# EAGLE design msx_vdp_slot (EAGLE 7.6.0)
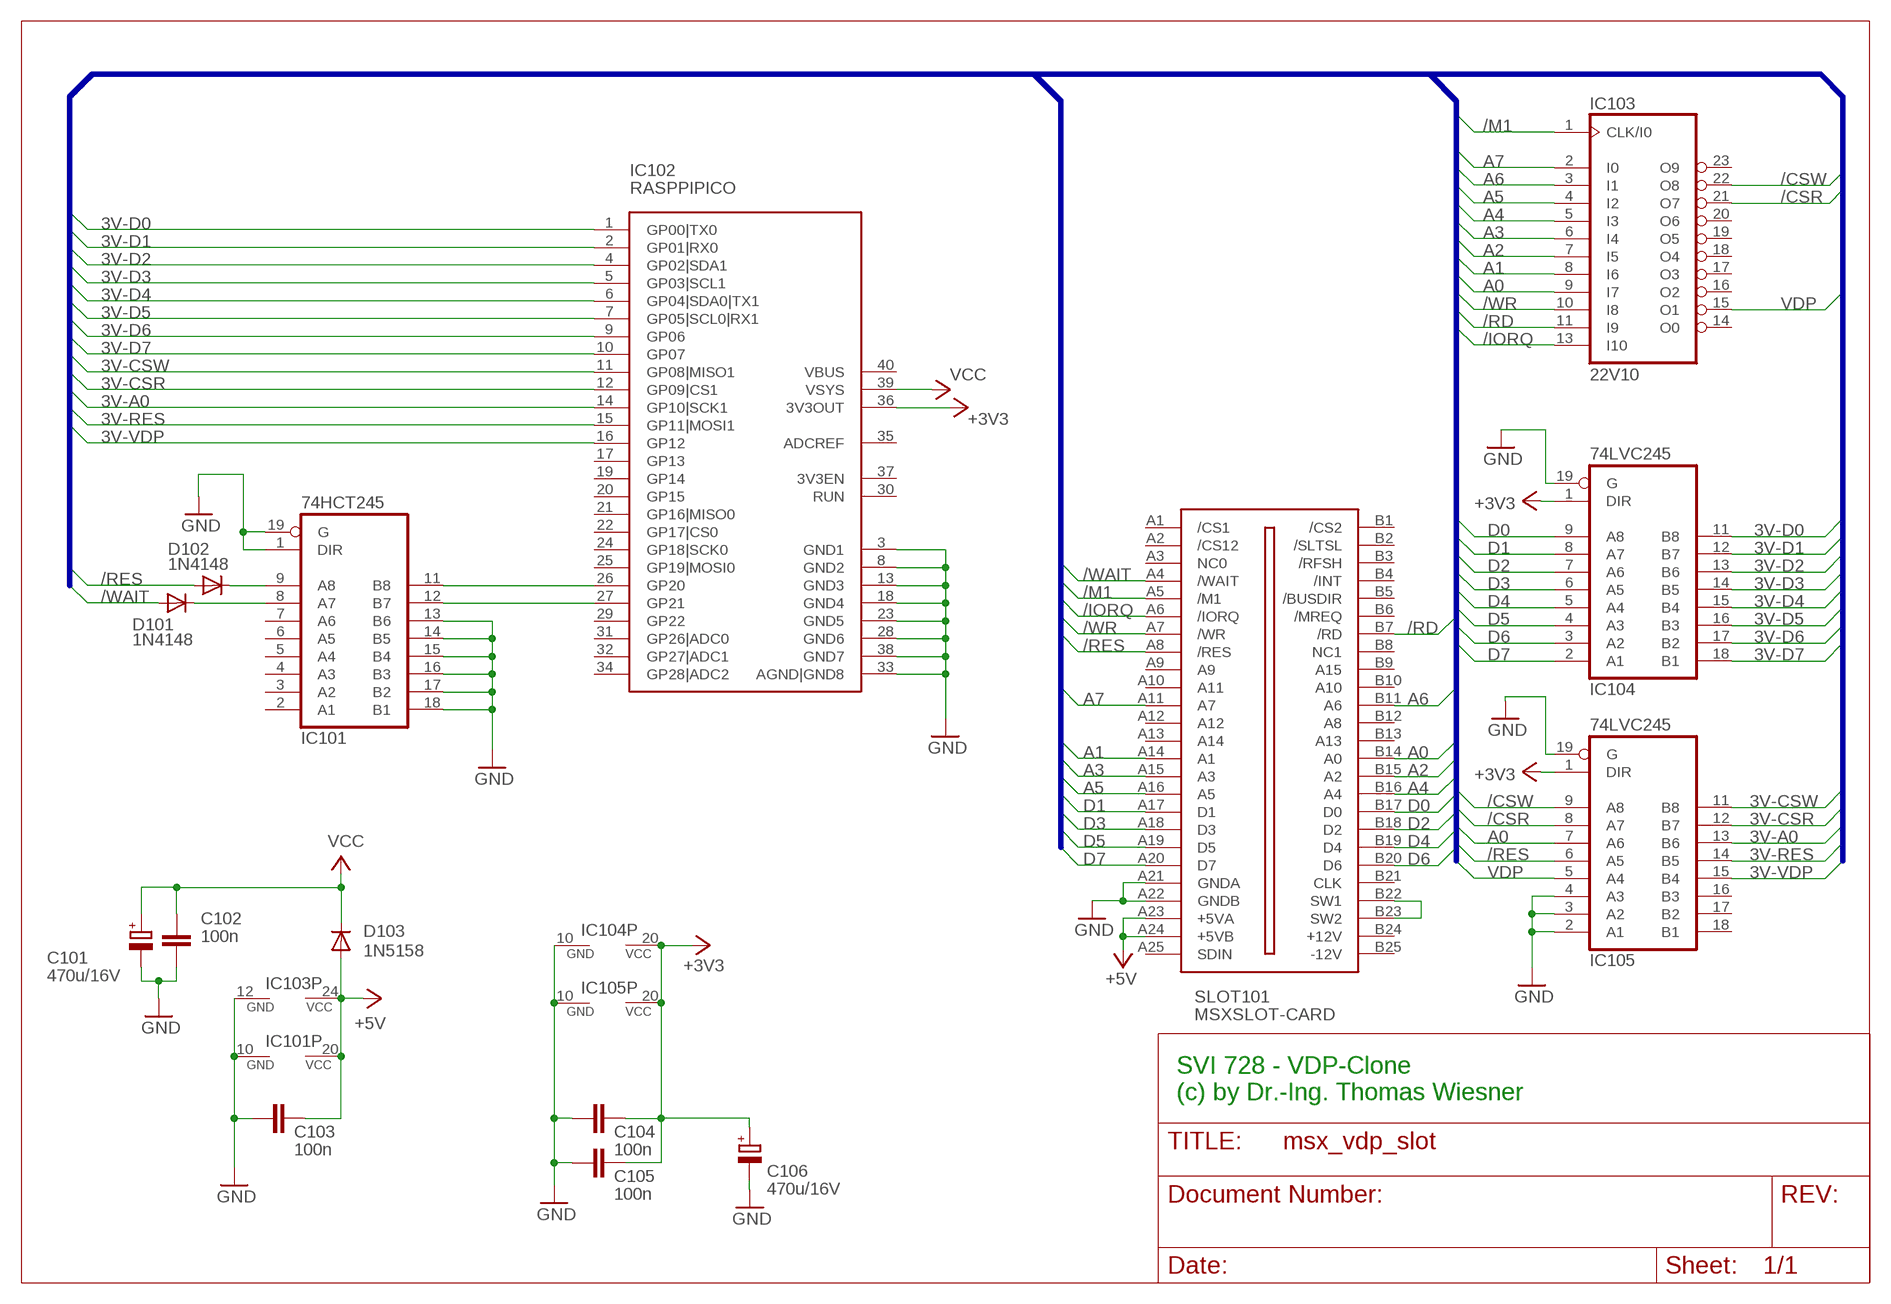
[diagram p0: schematic, sheet 1]

## Parts
C101  470u/16V  CPOL-EUE3.5-8  [E3,5-8]
C102  100n  C-EU025-025X050  [C025-025X050]
C103  100n  C-EU025-025X050  [C025-025X050]
C104  100n  C-EU025-025X050  [C025-025X050]
C105  100n  C-EU025-025X050  [C025-025X050]
C106  470u/16V  CPOL-EUE3.5-8  [E3,5-8]
D101  1N4148  1N4148DO35-10  [DO35-10]
D102  1N4148  1N4148DO35-10  [DO35-10]
D103  1N5158  1N4004  [DO41-10]
IC101  74HCT245  74HCT245N  [DIL20]
IC102  RASPPIPICO  [RASPPIPICO]
IC103  22V10  [DIL24-3]
IC104  74LVC245  74HCT245N  [DIL20]
IC105  74LVC245  74HCT245N  [DIL20]
SLOT101  MSXSLOT-CARD  [MSXCARD]

## Nets
3V-A0: IC102.14(GP10|SCK1) IC105.13(B6)
3V-CSR: IC102.12(GP09|CS1) IC105.12(B7)
3V-CSW: IC102.11(GP08|MISO1) IC105.11(B8)
3V-D0: IC102.1(GP00|TX0) IC104.11(B8)
3V-D1: IC102.2(GP01|RX0) IC104.12(B7)
3V-D2: IC102.4(GP02|SDA1) IC104.13(B6)
3V-D3: IC102.5(GP03|SCL1) IC104.14(B5)
3V-D4: IC102.6(GP04|SDA0|TX1) IC104.15(B4)
3V-D5: IC102.7(GP05|SCL0|RX1) IC104.16(B3)
3V-D6: IC102.9(GP06) IC104.17(B2)
3V-D7: IC102.10(GP07) IC104.18(B1)
3V-RES: IC102.15(GP11|MOSI1) IC105.14(B5)
3V-VDP: IC102.16(GP12) IC105.15(B4)
+3V3: C104.1 C105.1 C106.+ IC102.36(3V3OUT) IC104.1(DIR) IC104.20(VCC) IC105.1(DIR) IC105.20(VCC)
+5V: C103.1 D103.A IC101.20(VCC) IC103.24(VCC) SLOT101.A23(+5VA) SLOT101.A24(+5VB)
/CSR: IC103.21(O7) IC105.8(A7)
/CSW: IC103.22(O8) IC105.9(A8)
/IORQ: IC103.13(I10) SLOT101.A6(/IORQ)
/M1: IC103.1(CLK/I0) SLOT101.A5(/M1)
/RD: IC103.11(I9) SLOT101.B7(/RD)
/RES: D102.A IC105.6(A5) SLOT101.A8(/RES)
/WAIT: D101.A SLOT101.A4(/WAIT)
/WR: IC103.10(I8) SLOT101.A7(/WR)
A0: IC103.9(I7) IC105.7(A6) SLOT101.B14(A0)
A1: IC103.8(I6) SLOT101.A14(A1)
A2: IC103.7(I5) SLOT101.B15(A2)
A3: IC103.6(I4) SLOT101.A15(A3)
A4: IC103.5(I3) SLOT101.B16(A4)
A5: IC103.4(I2) SLOT101.A16(A5)
A6: IC103.3(I1) SLOT101.B11(A6)
A7: IC103.2(I0) SLOT101.A11(A7)
D0: IC104.9(A8) SLOT101.B17(D0)
D1: IC104.8(A7) SLOT101.A17(D1)
D2: IC104.7(A6) SLOT101.B18(D2)
D3: IC104.6(A5) SLOT101.A18(D3)
D4: IC104.5(A4) SLOT101.B19(D4)
D5: IC104.4(A3) SLOT101.A19(D5)
D6: IC104.3(A2) SLOT101.B20(D6)
D7: IC104.2(A1) SLOT101.A20(D7)
GND: C101.- C102.2 C103.2 C104.2 C105.2 C106.- IC101.1(DIR) IC101.10(GND) IC101.13(B6) IC101.14(B5) IC101.15(B4) IC101.16(B3) IC101.17(B2) IC101.18(B1) IC101.19(G) IC102.3(GND1) IC102.8(GND2) IC102.13(GND3) IC102.18(GND4) IC102.23(GND5) IC102.28(GND6) IC102.33(AGND|GND8) IC102.38(GND7) IC103.12(GND) IC104.10(GND) IC104.19(G) IC105.2(A1) IC105.3(A2) IC105.4(A3) IC105.10(GND) IC105.19(G) SLOT101.A21(GNDA) SLOT101.A22(GNDB)
N$1: D102.C IC101.9(A8)
N$2: D101.C IC101.8(A7)
N$3: IC101.12(B7) IC102.27(GP21)
N$4: IC101.11(B8) IC102.26(GP20)
N$17: SLOT101.B22(SW1) SLOT101.B23(SW2)
VCC: C101.+ C102.1 D103.C IC102.39(VSYS)
VDP: IC103.15(O1) IC105.5(A4)
Unconnected: IC101.2(A1) IC101.3(A2) IC101.4(A3) IC101.5(A4) IC101.6(A5) IC101.7(A6) IC102.17(GP13) IC102.19(GP14) IC102.20(GP15) IC102.21(GP16|MISO0) IC102.22(GP17|CS0) IC102.24(GP18|SCK0) IC102.25(GP19|MOSI0) IC102.29(GP22) IC102.30(RUN) IC102.31(GP26|ADC0) IC102.32(GP27|ADC1) IC102.34(GP28|ADC2) IC102.37(3V3EN) IC103.14(O0) IC103.16(O2) IC103.17(O3) IC103.18(O4) IC103.19(O5) IC103.20(O6) IC103.23(O9) IC105.16(B3) IC105.17(B2) IC105.18(B1) SLOT101.A1(/CS1) SLOT101.A2(/CS12) SLOT101.A3(NC0) SLOT101.A9 SLOT101.A10(A11) SLOT101.A12 SLOT101.A13(A14) SLOT101.A25(SDIN) SLOT101.B1(/CS2) SLOT101.B2(/SLTSL) SLOT101.B3(/RFSH) SLOT101.B4(/INT) SLOT101.B5(/BUSDIR) SLOT101.B6(/MREQ) SLOT101.B8(NC1) SLOT101.B9(A15) SLOT101.B10(A10) SLOT101.B12(A8) SLOT101.B13(A13) SLOT101.B21(CLK) SLOT101.B24(+12V) SLOT101.B25(-12V)

## Buses
B$4

## Notes on the sheet
- SVI 728 - VDP-Clone
  (c) by Dr.-Ing. Thomas Wiesner

## Power pins joined to a net without a drawn wire
ADCREF: IC102.35(ADCREF)
VBUS: IC102.40(VBUS)

## Library data of the parts
C101 C106 = rcl:CPOL-EU: POLARIZED CAPACITOR, European symbol
C102-C105 = rcl:C-EU: CAPACITOR, European symbol
D101 D102 = diode:1N4148: DIODE high speed (Philips)
D103 = diode:1N4004: DIODE general purpose rectifier, 1 A
IC101 IC104 IC105 = 74xx-eu:74*245: Octal BUS TRANSCEIVER, 3-state
IC102 = mbc:RASPPIPICO
IC103 = pal:22V10: PAL; MPN: GAL22V10D-7LPN; OC_FARNELL: 1571925; OC_NEWARK: 97M0480
SLOT101 = mbc:MSXSLOT: MSX-Slot-Verbinder

## Board
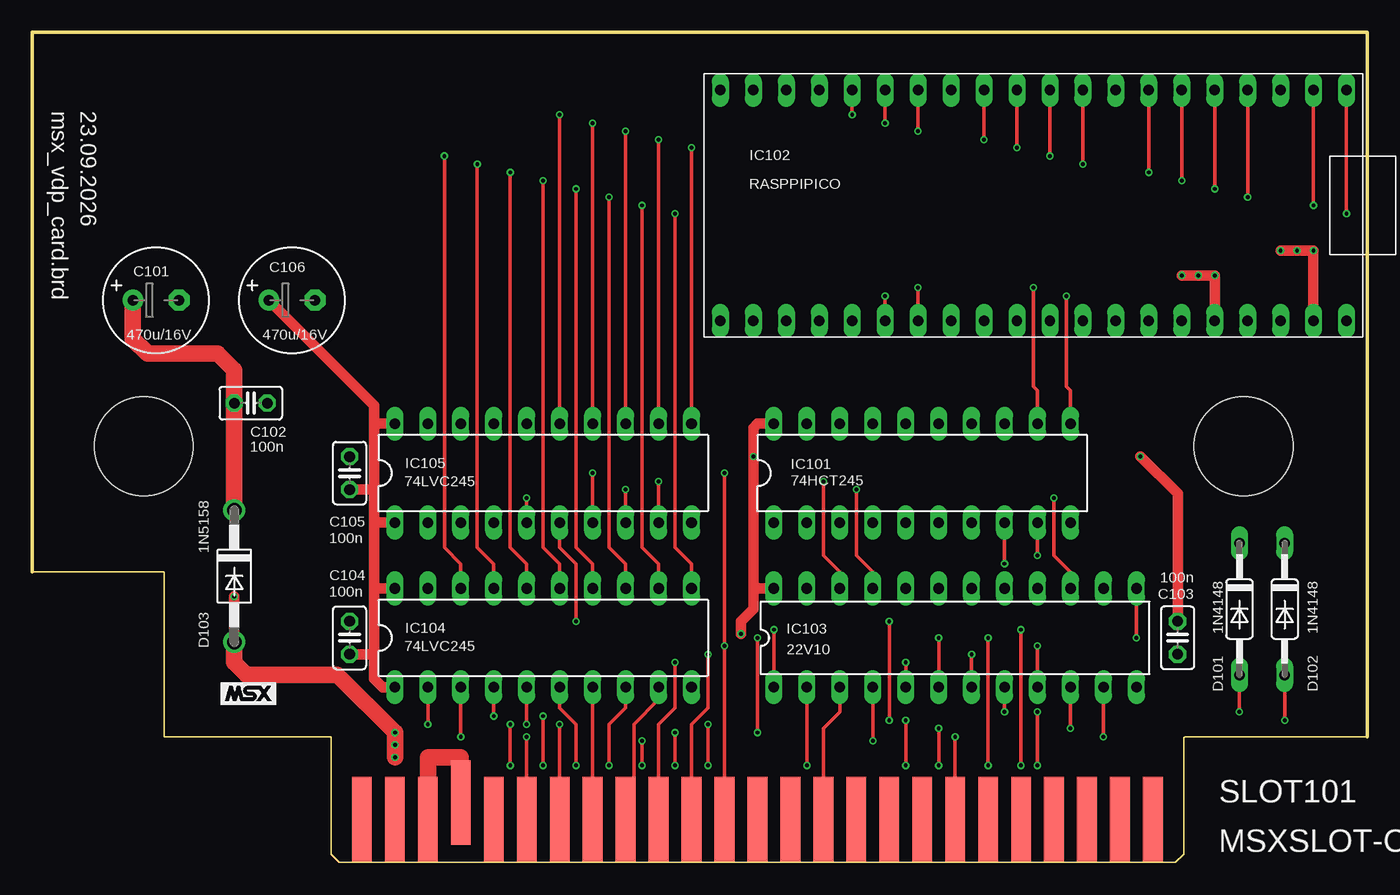
[diagram p1: board, top side]
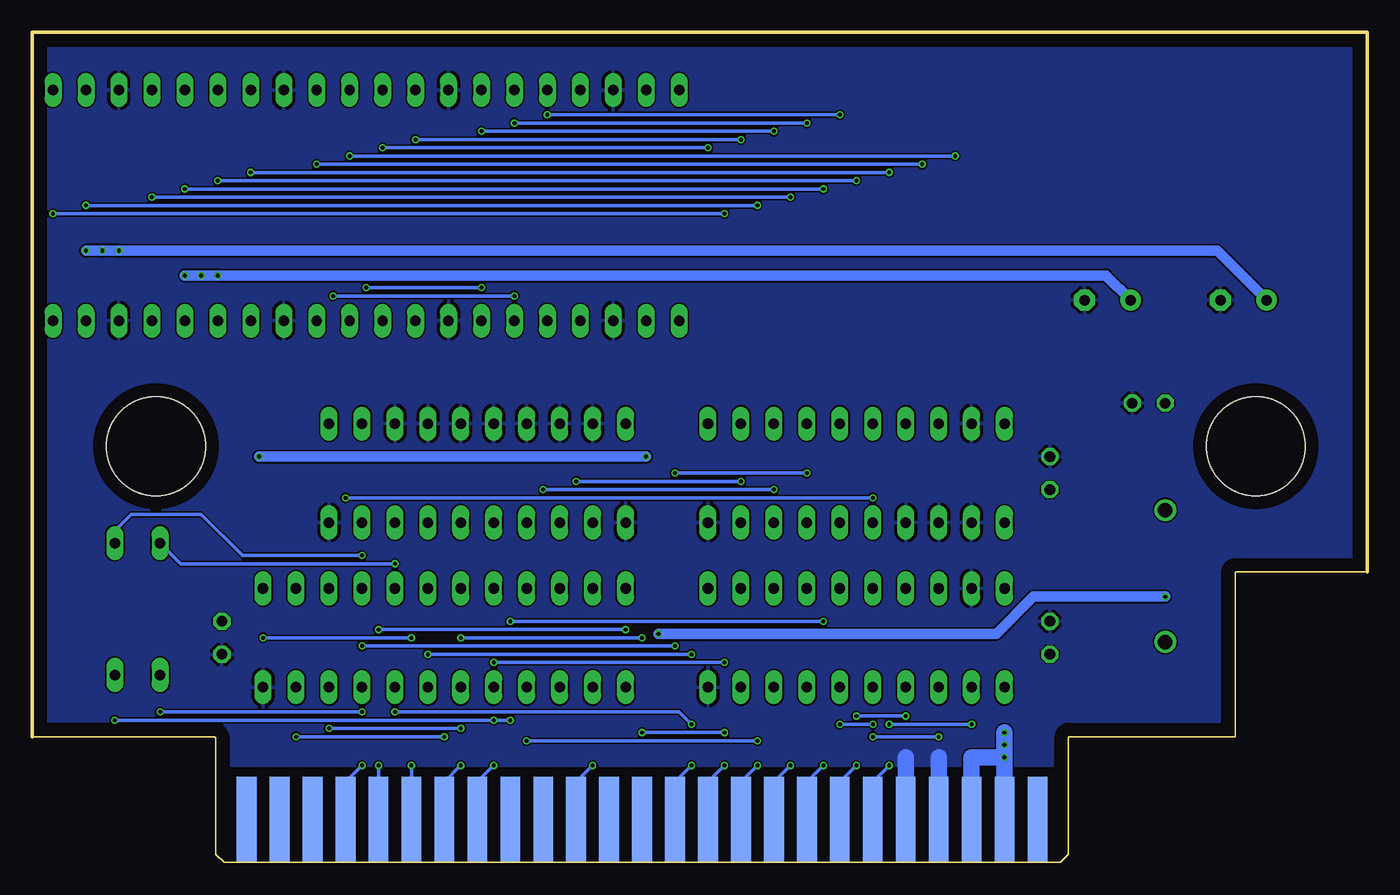
[diagram p2: board, bottom side, seen from below]

Size 102.87 x 63.98 mm. Coordinates in mm from the lower left corner, seen from the top.
Outline: 0,22.38 0,63.98 102.87,63.98 102.87,9.68
Copper layers (1*16): Top 0.035mm / dielectric 1.5mm / Bottom 0.035mm
Design rules "default *": minimum track width 0.125mm, minimum drill 0.2mm, track to track 0.125mm, track to pad 0.125mm, pad to pad 0.125mm, via to via 0.125mm, smd to smd 0.125mm, copper to edge 40mil, drill to drill 8mil, minimum pad ring 10mil, minimum via ring 0.125mm, stop-mask expansion 4mil, vias tented up to drill 0mil, thermal gap 10mil

### Footprints (pad centres in the part's own frame; a part is rotated, then mirrored left to right if it is on the bottom)
E3,5-8 = drill 0.813 pad 1.6: + -1.778,0 | drill 0.813 pad 1.6 octagon: - 1.778,0
C025-025X050 = drill 0.813 octagon: 1 -1.27,0; 2 1.27,0
DO35-10 = drill 0.813 long: A 5.08,0; C -5.08,0
DO41-10 = drill 1.118: A 5.08,0; C -5.08,0
DIL20 = drill 0.813 long: 1 -11.43,-3.81; 2 -8.89,-3.81; 3 -6.35,-3.81; 4 -3.81,-3.81; 5 -1.27,-3.81; 6 1.27,-3.81; 7 3.81,-3.81; 8 6.35,-3.81; 9 8.89,-3.81; 10 11.43,-3.81; 11 11.43,3.81; 12 8.89,3.81; 13 6.35,3.81; 14 3.81,3.81; 15 1.27,3.81; 16 -1.27,3.81; 17 -3.81,3.81; 18 -6.35,3.81; 19 -8.89,3.81; 20 -11.43,3.81
RASPPIPICO = drill 0.8 long: 1 -8.89,24.13; 2 -8.89,21.59; 3 -8.89,19.05; 4 -8.89,16.51; 5 -8.89,13.97; 6 -8.89,11.43; 7 -8.89,8.89; 8 -8.89,6.35; 9 -8.89,3.81; 10 -8.89,1.27; 11 -8.89,-1.27; 12 -8.89,-3.81; 13 -8.89,-6.35; 14 -8.89,-8.89; 15 -8.89,-11.43; 16 -8.89,-13.97; 17 -8.89,-16.51; 18 -8.89,-19.05; 19 -8.89,-21.59; 20 -8.89,-24.13; 21 8.89,-24.13; 22 8.89,-21.59; 23 8.89,-19.05; 24 8.89,-16.51; 25 8.89,-13.97; 26 8.89,-11.43; 27 8.89,-8.89; 28 8.89,-6.35; 29 8.89,-3.81; 30 8.89,-1.27; 31 8.89,1.27; 32 8.89,3.81; 33 8.89,6.35; 34 8.89,8.89; 35 8.89,11.43; 36 8.89,13.97; 37 8.89,16.51; 38 8.89,19.05; 39 8.89,21.59; 40 8.89,24.13
DIL24-3 = drill 0.813 long: 1 -13.97,-3.81; 2 -11.43,-3.81; 3 -8.89,-3.81; 4 -6.35,-3.81; 5 -3.81,-3.81; 6 -1.27,-3.81; 7 1.27,-3.81; 8 3.81,-3.81; 9 6.35,-3.81; 10 8.89,-3.81; 11 11.43,-3.81; 12 13.97,-3.81; 13 13.97,3.81; 14 11.43,3.81; 15 8.89,3.81; 16 6.35,3.81; 17 3.81,3.81; 18 1.27,3.81; 19 -1.27,3.81; 20 -3.81,3.81; 21 -6.35,3.81; 22 -8.89,3.81; 23 -11.43,3.81; 24 -13.97,3.81
MSXCARD = smd 1.524 x 6.477 bottom: A1 -25.4,2.54; A2 -27.94,2.54; A3 -30.48,2.54; A4 -33.02,2.54; A5 -35.56,2.54; A6 -38.1,2.54; A7 -40.64,2.54; A8 -43.18,2.54; A9 -45.72,2.54; A10 -48.26,2.54; A11 -50.8,2.54; A12 -53.34,2.54; A13 -55.88,2.54; A14 -58.42,2.54; A15 -60.96,2.54; A16 -63.5,2.54; A17 -66.04,2.54; A18 -68.58,2.54; A19 -71.12,2.54; A20 -73.66,2.54; A21 -76.2,2.54; A22 -78.74,2.54; A23 -81.28,2.54; A24 -83.82,2.54; A25 -86.36,2.54 | smd 1.524 x 6.477: B1 -25.4,2.54; B2 -27.94,2.54; B3 -30.48,2.54; B4 -33.02,2.54; B5 -35.56,2.54; B6 -38.1,2.54; B7 -40.64,2.54; B8 -43.18,2.54; B9 -45.72,2.54; B10 -48.26,2.54; B11 -50.8,2.54; B12 -53.34,2.54; B13 -55.88,2.54; B14 -58.42,2.54; B15 -60.96,2.54; B16 -63.5,2.54; B17 -66.04,2.54; B18 -68.58,2.54; B19 -71.12,2.54; B20 -73.66,2.54; B21 -76.2,2.54; B22 -78.74,3.81; B23 -81.28,2.54; B24 -83.82,2.54; B25 -86.36,2.54 | hole 7.62: -103.188,31.274; -18.415,31.274

### Placement (x,y rotation side)
C101  9.53,43.34 0 top
C102  16.83,35.4 0 top
C103  88.27,17.3 270 top
C104  24.45,17.3 90 top
C105  24.45,30 90 top
C106  20,43.34 0 top
D101  93.03,19.53 270 top
D102  96.52,19.53 270 top
D103  15.56,22.07 270 top
IC101  68.58,30 0 top
IC102  77.15,50.64 270 top
IC103  71.12,17.3 0 top
IC104  39.37,17.3 0 top
IC105  39.37,30 0 top
SLOT101  111.76,0.79 0 top

### Tracks (layer width: path | path; a pad name or v marks a point on that pad's centre or on a via)
3V-A0  (via drill 0.3)
  Top 0.254: IC105.13 v45.72,56.36 | v68.26,56.36 IC102.14
  Bottom 0.254: v45.72,56.36 v68.26,56.36
3V-CSR  (via drill 0.3)
  Top 0.254: IC105.12 v48.26,55.72 | v73.34,55.72 IC102.12
  Bottom 0.254: v48.26,55.72 v73.34,55.72
3V-CSW  (via drill 0.3)
  Top 0.254: IC105.11 v50.8,55.09 | v75.88,55.09 IC102.11
  Bottom 0.254: v50.8,55.09 v75.88,55.09
3V-D0  (via drill 0.3)
  Top 0.254: IC104.11 50.8,23.02 49.53,24.29 v49.53,50.01 | v101.28,50.01 IC102.1
  Bottom 0.254: v49.53,50.01 v101.28,50.01
3V-D1  (via drill 0.3)
  Top 0.254: IC104.12 48.26,23.02 46.99,24.29 v46.99,50.64 | v98.74,50.64 IC102.2
  Bottom 0.254: v46.99,50.64 v98.74,50.64
3V-D2  (via drill 0.3)
  Top 0.254: IC104.13 45.72,23.02 44.45,24.29 v44.45,51.28 | v93.66,51.28 IC102.4
  Bottom 0.254: v44.45,51.28 v93.66,51.28
3V-D3  (via drill 0.3)
  Top 0.254: IC104.14 43.18,23.02 41.91,24.29 v41.91,51.91 | v91.12,51.91 IC102.5
  Bottom 0.254: v41.91,51.91 v91.12,51.91
3V-D4  (via drill 0.3)
  Top 0.254: IC104.15 40.64,23.02 39.37,24.29 v39.37,52.55 | v88.58,52.55 IC102.6
  Bottom 0.254: v39.37,52.55 v88.58,52.55
3V-D5  (via drill 0.3)
  Top 0.254: IC104.16 38.1,23.02 36.83,24.29 v36.83,53.18 | v86.04,53.18 IC102.7
  Bottom 0.254: v36.83,53.18 v86.04,53.18
3V-D6  (via drill 0.3)
  Top 0.254: IC104.17 35.56,23.02 34.29,24.29 v34.29,53.82 | v80.96,53.82 IC102.9
  Bottom 0.254: v34.29,53.82 v80.96,53.82
3V-D7  (via drill 0.3)
  Top 0.254: IC104.18 33.02,23.02 31.75,24.29 v31.75,54.45 | v78.42,54.45 IC102.10
  Bottom 0.254: v31.75,54.45 v78.42,54.45
3V-RES  (via drill 0.3)
  Top 0.254: IC105.14 v43.18,56.99 | v65.72,56.99 IC102.15
  Bottom 0.254: v43.18,56.99 v65.72,56.99
3V-VDP  (via drill 0.3)
  Top 0.254: IC105.15 v40.64,57.63 | v63.18,57.63 IC102.16
  Bottom 0.254: v40.64,57.63 v63.18,57.63
+3V3  (via drill 0.3)
  Top 0.813: IC104.1 26.99,13.49 26.35,14.13 26.35,16.03 | 26.35,16.03 26.35,21.11 | 26.35,21.11 26.35,26.19 | 26.35,26.19 26.35,28.73 | 26.35,28.73 26.35,33.81 | 26.35,33.81 26.35,35.21 C106.+ | C105.1 26.35,28.73 | IC104.20 26.35,21.11 | IC105.1 26.35,26.19 | C104.1 26.35,16.03 | IC105.20 26.35,33.81 | IC102.36 v91.12,45.24 v89.85,45.24 v88.58,45.24
  Bottom 0.813: C106.+ 20.13,45.24 v88.58,45.24 v89.85,45.24 v91.12,45.24
+5V  (via drill 0.3)
  Top 0.813: IC101.20 55.88,33.81 55.56,33.5 v55.56,31.27 55.56,21.43 | 55.56,21.43 55.88,21.11 IC103.24 | C103.1 88.27,28.42 v85.41,31.27 | 55.56,21.43 55.56,19.53 54.61,18.57 v54.61,17.62 | v15.56,20.48 D103.A
  Top 1.27: D103.A 15.56,15.4 16.51,14.45 23.5,14.45 v27.94,10 v27.94,9.05 v27.94,8.1
  Bottom 0.813: v85.41,31.27 v55.56,31.27 | v54.61,17.62 28.58,17.62 25.72,20.48 v15.56,20.48
  Bottom 1.27: SLOT101.A23 30.48,8.1 v27.94,8.1 | v27.94,8.1 SLOT101.A24 | v27.94,8.1 v27.94,9.05 v27.94,10
/CSR  (via drill 0.3)
  Top 0.254: IC103.21 64.77,22.38 63.5,23.65 v63.5,28.73 | v45.72,28.73 IC105.8
  Bottom 0.254: v63.5,28.73 v45.72,28.73
/CSW  (via drill 0.3)
  Top 0.254: IC103.22 62.23,22.38 60.96,23.65 v60.96,29.37 | v48.26,29.37 IC105.9
  Bottom 0.254: v60.96,29.37 v48.26,29.37
/IORQ  (via drill 0.3)
  Top 0.254: v73.66,7.46 v73.66,17.3 | v85.09,17.3 IC103.13
  Bottom 0.254: SLOT101.A6 v73.66,7.46 | v73.66,17.3 v85.09,17.3
/M1  (via drill 0.3)
  Top 0.254: v76.2,7.46 v76.2,17.94 | v57.15,17.94 IC103.1
  Bottom 0.254: SLOT101.A5 v76.2,7.46 | v76.2,17.94 v57.15,17.94
/RD  (via drill 0.3)
  Top 0.254: IC103.11 v82.55,9.68 | v71.12,9.68 SLOT101.B7
  Bottom 0.254: v82.55,9.68 v71.12,9.68
/RES  (via drill 0.3)
  Top 0.254: D102.A v96.52,10.95 | v67.31,10.95 v67.31,7.46 | IC105.6 40.64,24.29 41.91,23.02 v41.91,18.57 | v66.04,18.57 v66.04,10.95
  Bottom 0.254: SLOT101.A8 68.58,6.19 v67.31,7.46 | v96.52,10.95 v67.31,10.95 v66.04,10.95 | v41.91,18.57 v66.04,18.57
/WAIT  (via drill 0.3)
  Top 0.254: D101.A v93.03,11.59 | v77.47,11.59 v77.47,7.46
  Bottom 0.254: SLOT101.A4 78.74,6.19 v77.47,7.46 | v93.03,11.59 v77.47,11.59
/WR  (via drill 0.3)
  Top 0.254: IC103.10 v80.01,10.32 | v69.85,10.32 v69.85,7.46
  Bottom 0.254: SLOT101.A7 71.12,6.19 v69.85,7.46 | v80.01,10.32 v69.85,10.32
A0  (via drill 0.3)
  Top 0.254: v53.34,30 v53.34,16.67 SLOT101.B14 | v43.18,30 IC105.7 | v77.47,16.67 IC103.9
  Bottom 0.254: v53.34,30 v43.18,30 | v53.34,16.67 v77.47,16.67
A1  (via drill 0.3)
  Top 0.254: IC103.8 v74.93,11.59 | v52.07,10.64 v52.07,7.46
  Bottom 0.254: SLOT101.A14 53.34,6.19 v52.07,7.46 | v74.93,11.59 53.02,11.59 v52.07,10.64
A2  (via drill 0.3)
  Top 0.254: SLOT101.B15 50.8,10.64 52.07,11.91 v52.07,16.03 | v72.39,16.03 IC103.7
  Bottom 0.254: v52.07,16.03 v72.39,16.03
A3  (via drill 0.3)
  Top 0.254: IC103.6 v69.85,17.3 | v55.88,17.3 v55.88,10 | v49.53,10 v49.53,7.46
  Bottom 0.254: SLOT101.A15 50.8,6.19 v49.53,7.46 | v69.85,17.3 v55.88,17.3 | v55.88,10 v49.53,10
A4  (via drill 0.3)
  Top 0.254: SLOT101.B16 48.26,10.64 49.53,11.91 v49.53,15.4 | v67.31,15.4 IC103.5
  Bottom 0.254: v49.53,15.4 v67.31,15.4
A5  (via drill 0.3)
  Top 0.254: IC103.4 v64.77,9.37 | v46.99,9.37 v46.99,7.46
  Bottom 0.254: SLOT101.A16 48.26,6.19 v46.99,7.46 | v64.77,9.37 v46.99,9.37
A6
  Top 0.254: SLOT101.B11 60.96,10.32 62.23,11.59 IC103.3
A7  (via drill 0.3)
  Top 0.254: v59.69,7.46 IC103.2
  Bottom 0.254: SLOT101.A11 60.96,6.19 v59.69,7.46
D0
  Top 0.254: SLOT101.B17 45.72,5.24 46.36,5.87 46.36,10.64 48.26,12.54 IC104.9
D1  (via drill 0.3)
  Top 0.254: v44.45,7.46 44.45,10.64 45.72,11.91 IC104.8
  Bottom 0.254: SLOT101.A17 45.72,6.19 v44.45,7.46
D2
  Top 0.254: SLOT101.B18 IC104.7
D3  (via drill 0.3)
  Top 0.254: v41.91,7.46 41.91,10.64 40.64,11.91 IC104.6
  Bottom 0.254: SLOT101.A18 43.18,6.19 v41.91,7.46
D4  (via drill 0.3)
  Top 0.254: SLOT101.B19 v40.64,10.64 | v38.1,10.64 IC104.5
  Bottom 0.254: v40.64,10.64 v38.1,10.64
D5  (via drill 0.3)
  Top 0.254: v39.37,7.46 v39.37,11.27 | v35.56,11.27 IC104.4
  Bottom 0.254: SLOT101.A19 40.64,6.19 v39.37,7.46 | v39.37,11.27 v35.56,11.27
D6  (via drill 0.3)
  Top 0.254: SLOT101.B20 v38.1,9.68 | v33.02,9.68 IC104.3
  Bottom 0.254: v38.1,9.68 v33.02,9.68
D7  (via drill 0.3)
  Top 0.254: v36.83,7.46 v36.83,10.64 | v30.48,10.64 IC104.2
  Bottom 0.254: SLOT101.A20 38.1,6.19 v36.83,7.46 | v36.83,10.64 v30.48,10.64
GND
  Bottom 1.27: SLOT101.A21 35.56,8.1 | SLOT101.A22 33.02,8.1
  pour Bottom: 0,63.98 102.87,63.98 102.87,9.68 88.58,9.68 88.58,7.46 23.18,7.46 23.18,9.68 10.16,9.68 10.16,22.38 0,22.38
N$1  (via drill 0.3)
  Top 0.254: IC101.9 v77.47,23.65
  Bottom 0.254: v77.47,23.65 86.68,23.65 89.85,26.83 95.25,26.83 96.52,25.56 D102.C
N$2  (via drill 0.3)
  Top 0.254: IC101.8 v74.93,23.02
  Bottom 0.254: v74.93,23.02 91.44,23.02 D101.C
N$3  (via drill 0.3)
  Top 0.254: IC101.12 77.47,36.35 77.15,36.67 v77.15,44.29 | v68.26,44.29 IC102.27
  Bottom 0.254: v77.15,44.29 v68.26,44.29
N$4  (via drill 0.3)
  Top 0.254: IC101.11 80.01,36.35 79.69,36.67 v79.69,43.66 | v65.72,43.66 IC102.26
  Bottom 0.254: v79.69,43.66 v65.72,43.66
N$17
  Top 1.27: SLOT101.B22 33.02,8.1 30.48,8.1 SLOT101.B23
VCC  (via drill 0.3)
  Top 0.813: IC102.39 v98.74,47.15 v97.47,47.15 v96.2,47.15
  Top 1.27: C101.+ 7.75,40.35 8.89,39.21 14.29,39.21 15.56,37.94 C102.1 D103.C
  Bottom 0.813: C101.+ 11.56,47.15 v96.2,47.15 v97.47,47.15 v98.74,47.15
VDP  (via drill 0.3)
  Top 0.254: IC103.15 80.01,22.38 78.74,23.65 v78.74,28.1 | v38.1,28.1 IC105.5
  Bottom 0.254: v78.74,28.1 v38.1,28.1

### Text on the board
tNames: msx_vdp_card.brd | 23.09.2026